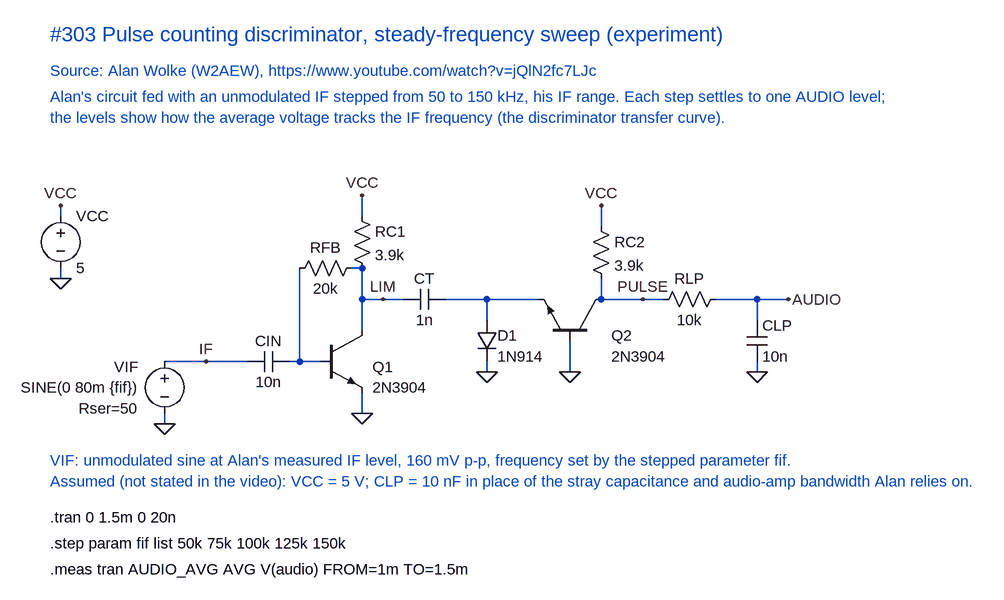
[diagram p0: schematic Pulse counting discriminator - frequency sweep.asc]
Pulse counting discriminator - frequency sweep.asc, the LTspice schematic file:
Version 4.1
SHEET 1 1200 900
WIRE 352 80 352 112
WIRE 720 96 720 128
WIRE -112 96 -112 112
WIRE 336 192 352 192
WIRE 352 192 352 288
WIRE 256 192 256 336
WIRE 720 208 720 240
WIRE 352 240 416 240
WIRE 480 240 544 240
WIRE 544 240 624 240
WIRE 720 240 816 240
WIRE 896 240 960 240
WIRE 960 240 1008 240
WIRE 544 240 544 272
WIRE 960 240 960 272
WIRE 672 304 672 352
WIRE 960 336 960 352
WIRE 544 336 544 352
WIRE 48 336 176 336
WIRE 240 336 256 336
WIRE 256 336 288 336
WIRE 352 384 352 416
WIRE -112 192 -112 208
WIRE 48 416 48 432
FLAG -112 96 VCC
FLAG -112 208 0
FLAG 48 432 0
FLAG 112 336 IF
FLAG 352 80 VCC
FLAG 720 96 VCC
FLAG 352 416 0
FLAG 544 352 0
FLAG 672 352 0
FLAG 960 352 0
FLAG 384 240 LIM
FLAG 784 240 PULSE
FLAG 1008 240 AUDIO
SYMBOL voltage -112 96 R0
WINDOW 0 24 16 Left 2
WINDOW 3 24 96 Left 2
SYMATTR InstName VCC
SYMATTR Value 5
SYMBOL voltage 48 320 R0
WINDOW 0 -40 24 Right 2
WINDOW 3 -40 56 Right 2
WINDOW 123 0 0 Left 0
WINDOW 39 -40 88 Right 2
SYMATTR InstName VIF
SYMATTR Value SINE(0 80m {fif})
SYMATTR SpiceLine Rser=50
SYMBOL cap 176 352 R270
WINDOW 0 32 32 VTop 2
WINDOW 3 0 32 VBottom 2
SYMATTR InstName CIN
SYMATTR Value 10n
SYMBOL res 240 208 R270
WINDOW 0 32 56 VTop 2
WINDOW 3 0 56 VBottom 2
SYMATTR InstName RFB
SYMATTR Value 20k
SYMBOL res 336 96 R0
WINDOW 0 36 40 Left 2
WINDOW 3 36 76 Left 2
SYMATTR InstName RC1
SYMATTR Value 3.9k
SYMBOL npn 288 288 R0
WINDOW 0 80 56 Left 2
WINDOW 3 80 88 Left 2
SYMATTR InstName Q1
SYMATTR Value 2N3904
SYMBOL cap 416 256 R270
WINDOW 0 32 32 VTop 2
WINDOW 3 0 32 VBottom 2
SYMATTR InstName CT
SYMATTR Value 1n
SYMBOL diode 528 272 R0
WINDOW 0 32 24 Left 2
WINDOW 3 32 56 Left 2
SYMATTR InstName D1
SYMATTR Value 1N914
SYMBOL npn 720 304 M270
WINDOW 0 8 -16 VLeft 2
WINDOW 3 -24 -16 VLeft 2
SYMATTR InstName Q2
SYMATTR Value 2N3904
SYMBOL res 704 112 R0
WINDOW 0 36 40 Left 2
WINDOW 3 36 76 Left 2
SYMATTR InstName RC2
SYMATTR Value 3.9k
SYMBOL res 800 256 R270
WINDOW 0 32 56 VTop 2
WINDOW 3 0 56 VBottom 2
SYMATTR InstName RLP
SYMATTR Value 10k
SYMBOL cap 944 272 R0
WINDOW 0 24 8 Left 2
WINDOW 3 24 56 Left 2
SYMATTR InstName CLP
SYMATTR Value 10n
TEXT -128 -168 Left 3 ;#303 Pulse counting discriminator, steady-frequency sweep (experiment)
TEXT -128 -112 Left 2 ;Source: Alan Wolke (W2AEW), https://www.youtube.com/watch?v=jQlN2fc7LJc
TEXT -128 -72 Left 2 ;Alan's circuit fed with an unmodulated IF stepped from 50 to 150 kHz, his IF range. Each step settles to one AUDIO level;
TEXT -128 -40 Left 2 ;the levels show how the average voltage tracks the IF frequency (the discriminator transfer curve).
TEXT -128 488 Left 2 ;VIF: unmodulated sine at Alan's measured IF level, 160 mV p-p, frequency set by the stepped parameter fif.
TEXT -128 520 Left 2 ;Assumed (not stated in the video): VCC = 5 V; CLP = 10 nF in place of the stray capacitance and audio-amp bandwidth Alan relies on.
TEXT -128 576 Left 2 !.tran 0 1.5m 0 20n
TEXT -128 616 Left 2 !.step param fif list 50k 75k 100k 125k 150k
TEXT -128 656 Left 2 !.meas tran AUDIO_AVG AVG V(audio) FROM=1m TO=1.5m

The netlist it stands for:
* Pulse counting discriminator - frequency sweep.asc
VCC VCC 0 5
VIF IF 0 SINE(0 80m {fif}) Rser=50
CIN IF N001 10n
RFB N001 LIM 20k
RC1 VCC LIM 3.9k
Q1 LIM N001 0 0 2N3904
CT LIM N002 1n
D1 N002 0 1N914
Q2 PULSE 0 N002 0 2N3904
RC2 VCC PULSE 3.9k
RLP PULSE AUDIO 10k
CLP AUDIO 0 10n
.model D D
.lib standard.dio
.model NPN NPN
.model PNP PNP
.lib standard.bjt
* #303 Pulse counting discriminator, steady-frequency sweep (experiment)
* Source: Alan Wolke (W2AEW), https://www.youtube.com/watch?v=jQlN2fc7LJc
* Alan's circuit fed with an unmodulated IF stepped from 50 to 150 kHz, his IF range. Each step settles to one AUDIO level;
* the levels show how the average voltage tracks the IF frequency (the discriminator transfer curve).
* VIF: unmodulated sine at Alan's measured IF level, 160 mV p-p, frequency set by the stepped parameter fif.
* Assumed (not stated in the video): VCC = 5 V; CLP = 10 nF in place of the stray capacitance and audio-amp bandwidth Alan relies on.
.tran 0 1.5m 0 20n
.step param fif list 50k 75k 100k 125k 150k
.meas tran AUDIO_AVG AVG V(audio) FROM=1m TO=1.5m
.backanno
.end